# Altium schematic sheet SNES_Shoulder_Button.SchDoc
size A4; SheetNumber: 6; SheetTotal: 7
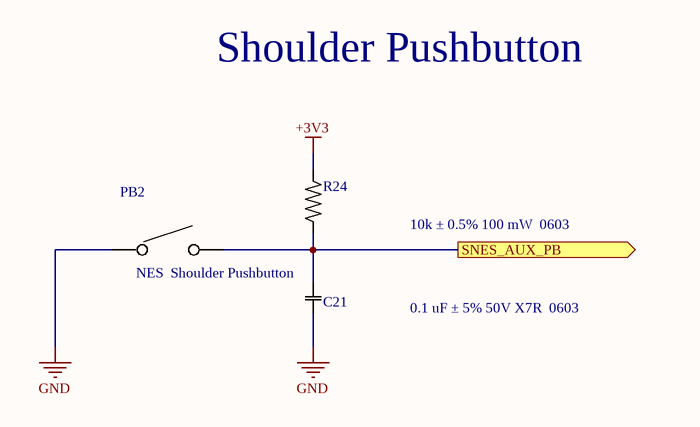
[diagram p0: SNES_Shoulder_Button.SchDoc]

## Parts
C21  0.1 uF ± 5% / 50V X7R / 0603  [0603_CAP]
PB2  NES  Shoulder Pushbutton  [SHOULDER_PB]
R24  10k ± 0.5% / 100 mW / 0603  [0603_RES]

## Ports
SNES_AUX_PB (out, see Game_Controller[3B])

## Nets
+3V3: R24.2
GND: C21.2 PB2.1
SNES_AUX_PB: C21.1 PB2.2 R24.1 ; port SNES_AUX_PB

## Notes on the sheet
- Shoulder Pushbutton

## Library data of the parts
C21 = 3: Manufacturer: Yageo; Manufacturer Part Number: CC0603JRX7R9BB104; CID: 3
PB2 = 27: Manufacturer: Custom; CID: 27; Manufacturer Part Number: Custom
R24 = 6: Manufacturer: Yageo; Manufacturer Part Number: AC0603DRE0710KL; CID: 6